# Altium schematic sheet SD_Card.SchDoc: SD Card
size A4; DocumentNumber: 14; SheetNumber: 12; SheetTotal: 16
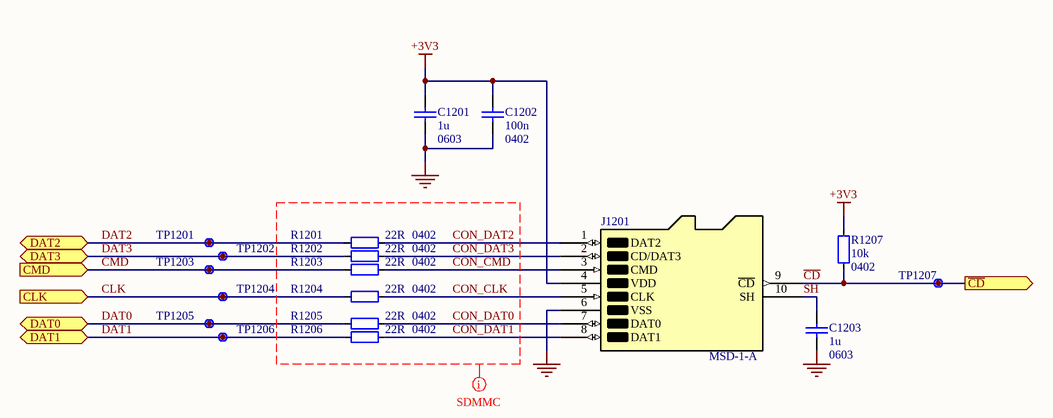
[diagram p0: SD_Card.SchDoc]

## Parts
C1201  1u  Footprint: 0603  [CAP_0603_B]
C1202  100n  Footprint: 0402  [CAP_0402_B]
C1203  1u  Footprint: 0603  [CAP_0603_B]
J1201  MSD-1-A  [MSD-1-A]
R1201  22R  Footprint: 0402  [RES_0402_A]
R1202  22R  Footprint: 0402  [RES_0402_A]
R1203  22R  Footprint: 0402  [RES_0402_A]
R1204  22R  Footprint: 0402  [RES_0402_A]
R1205  22R  Footprint: 0402  [RES_0402_A]
R1206  22R  Footprint: 0402  [RES_0402_A]
R1207  10k  Footprint: 0402  [RES_0402_A]
TP1201  Net  [Unlabelled Testpoint]  (value not drawn)
TP1202  Net  [Unlabelled Testpoint]  (value not drawn)
TP1203  Net  [Unlabelled Testpoint]  (value not drawn)
TP1204  Net  [Unlabelled Testpoint]  (value not drawn)
TP1205  Net  [Unlabelled Testpoint]  (value not drawn)
TP1206  Net  [Unlabelled Testpoint]  (value not drawn)
TP1207  Net  [Unlabelled Testpoint]  (value not drawn)

## Ports
CLK (in, see Top_Level[3C]), CMD (in, see Top_Level[3C]), DAT0 (bidir, see Top_Level[3C]), DAT1 (bidir, see Top_Level[3C]), DAT2 (bidir, see Top_Level[3C]), DAT3 (bidir, see Top_Level[3C]), ~{CD} (out, see Top_Level[3C])

## Nets
+3V3: C1201.1 C1202.1 J1201.4(VDD) R1207.1(a)
GND: C1201.2 C1202.2 C1203.2 J1201.6(VSS)
~{CD}: J1201.9(~{CD}) R1207.2(a) TP1207.1 ; port ~{CD}
CLK: R1204.1(a) TP1204.1 ; port CLK
CMD: R1203.1(a) TP1203.1 ; port CMD
CON_CLK: J1201.5(CLK) R1204.2(a)
CON_CMD: J1201.3(CMD) R1203.2(a)
CON_DAT0: J1201.7(DAT0) R1205.2(a)
CON_DAT1: J1201.8(DAT1) R1206.2(a)
CON_DAT2: J1201.1(DAT2) R1201.2(a)
CON_DAT3: J1201.2(CD/DAT3) R1202.2(a)
DAT0: R1205.1(a) TP1205.1 ; port DAT0
DAT1: R1206.1(a) TP1206.1 ; port DAT1
DAT2: R1201.1(a) TP1201.1 ; port DAT2
DAT3: R1202.1(a) TP1202.1 ; port DAT3
SH: C1203.1 J1201.10(SH)

## Layout directives
net class SDMMC: CON_CLK, CON_CMD, CON_DAT0, CON_DAT1, CON_DAT2, CON_DAT3

## Library data of the parts
C1201 C1203 = CAP_0603: 0603 SMD Capacitor
C1202 = CAP_0402: 0402 SMD Capacitor
J1201 = MSD-1-A: CONN MICROSD CARD R/A SMD; Supplier 1: Arrow Electronics; Supplier Part Number 1: MSD-1-A
R1201-R1207 = RES_0402: 0402 SMD Resistor
TP1201-TP1207 = Unlabelled Testpoint: Symbol for an unlabelled testpoint